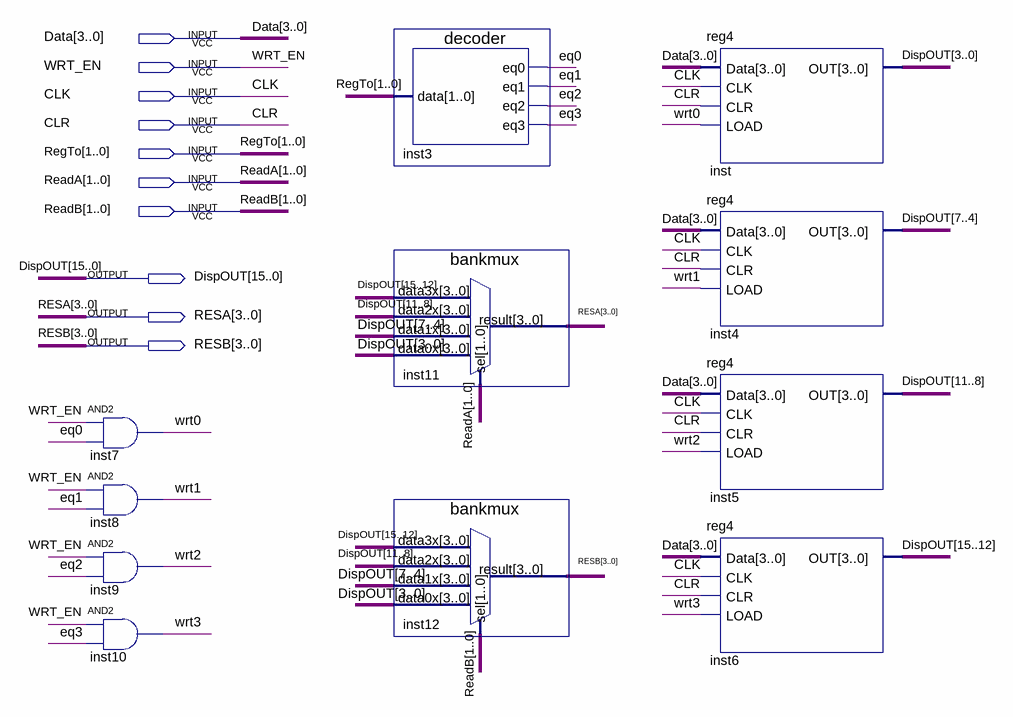
[diagram p0: schematic sheet]
// Quartus schematic regBank.bdf as structural Verilog: 11 symbols, 10 pins
module regBank (
  input  [3:0] Data,
  input  WRT_EN,
  input  CLK,
  input  CLR,
  input  [1:0] RegTo,
  input  [1:0] ReadA,
  input  [1:0] ReadB,
  output [15:0] DispOUT,
  output [3:0] RESA,
  output [3:0] RESB
);

  wire eq0, eq1, eq2, eq3, wrt0, wrt1, wrt2, wrt3;

  and inst7 (wrt0, WRT_EN, eq0);
  and inst8 (wrt1, WRT_EN, eq1);
  and inst9 (wrt2, WRT_EN, eq2);
  and inst10 (wrt3, WRT_EN, eq3);
  decoder inst3 (.data(RegTo), .eq0(eq0), .eq1(eq1), .eq2(eq2), .eq3(eq3));
  bankmux inst11 (
    .data3x(DispOUT[15:12]), .data2x(DispOUT[11:8]), .data1x(DispOUT[7:4]), .data0x(DispOUT[3:0]),
    .sel(ReadA), .result(RESA));
  bankmux inst12 (
    .data3x(DispOUT[15:12]), .data2x(DispOUT[11:8]), .data1x(DispOUT[7:4]), .data0x(DispOUT[3:0]),
    .sel(ReadB), .result(RESB));
  reg4 inst (.Data(Data), .CLK(CLK), .CLR(CLR), .LOAD(wrt0), .OUT(DispOUT[3:0]));
  reg4 inst4 (.Data(Data), .CLK(CLK), .CLR(CLR), .LOAD(wrt1), .OUT(DispOUT[7:4]));
  reg4 inst5 (.Data(Data), .CLK(CLK), .CLR(CLR), .LOAD(wrt2), .OUT(DispOUT[11:8]));
  reg4 inst6 (.Data(Data), .CLK(CLK), .CLR(CLR), .LOAD(wrt3), .OUT(DispOUT[15:12]));
endmodule
